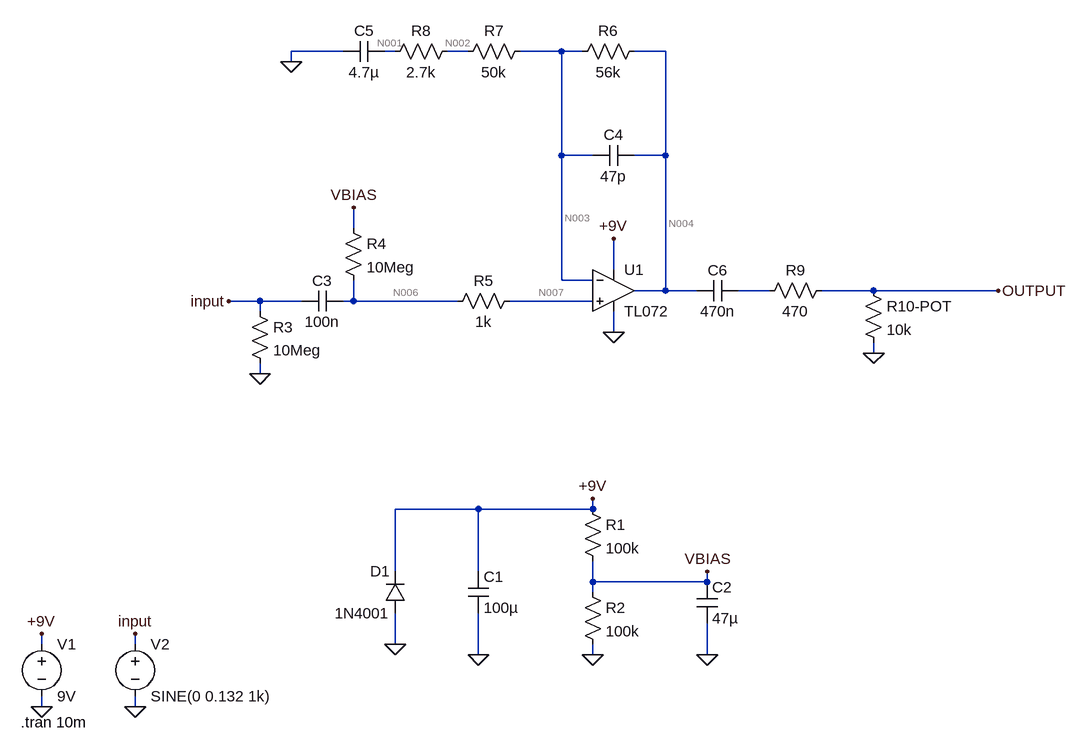
[diagram p0: schematic Boost Pedal.asc]
* Boost Pedal.asc
V1 +9V 0 9V
V2 input 0 SINE(0 0.132 1k)
D1 0 +9V 1N4001
C1 +9V 0 100µ V=25 Irms=250m Rser=0.6 Lser=0 mfg="Nichicon" pn="UPG1E101MPH" type="Al electrolytic"
R1 +9V VBIAS 100k
R2 VBIAS 0 100k
C2 VBIAS 0 47µ V=25 Irms=170m Rser=1 Lser=0 mfg="Nichicon" pn="UPG1E470MPH" type="Al electrolytic"
R3 input 0 10Meg
C3 N006 input 100n
R4 VBIAS N006 10Meg
R5 N007 N006 1k
* U1: TL072 (symbol TL072 not available, pins judged from their places): In+=N007 In-=N003 V+=+9V V-=0 OUT=N004
C4 N004 N003 47p
R6 N004 N003 56k
R7 N003 N002 50k
R8 N002 N001 2.7k
C5 N001 0 4.7µ V=25 Irms=24m Rser=5 Lser=0 mfg="Nichicon" pn="UPR1E4R7MAH" type="Al electrolytic"
C6 N005 N004 470n
R9 OUTPUT N005 470
R10-POT OUTPUT 0 10k
.model D D
.lib standard.dio
.tran 10m
.backanno
.end

* Results of the author's LTspice run, read from the files saved beside the schematic
* Operating Point, zero values left out:
*   V(+9v) = 9 V
*   V(n001) = 4.5 V
*   V(n002) = 4.5 V
*   V(n003) = 4.5 V
*   V(n004) = 4.5 V
*   V(n006) = 4.5 V
*   V(n007) = 4.5 V
*   V(vbias) = 4.5 V
*   I(D1) = -14.12 nA
*   I(R1) = 45 µA
*   I(R2) = 45 µA
*   I(R4) = 34.55 pA
*   I(R5) = -34.55 pA
*   I(R6) = 34.55 pA
*   I(V1) = -4.44 mA
*   Ix(u1:1) = 34.55 pA
*   Ix(u1:2) = 34.55 pA
*   Ix(u1:3) = 4.395 mA
*   Ix(u1:4) = -4.395 mA
*   Ix(u1:5) = -34.55 pA
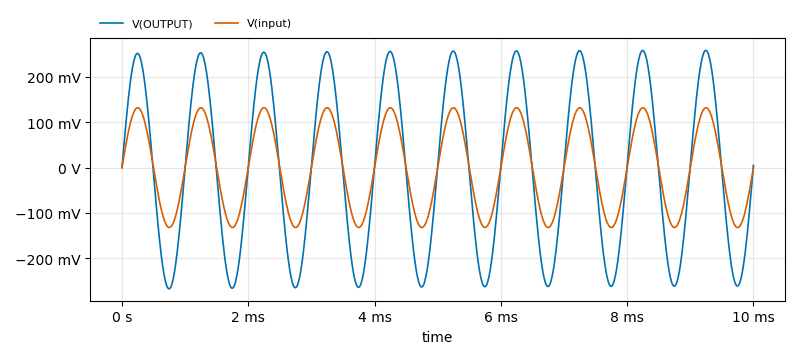
[diagram p1: Transient Analysis of Boost Pedal.asc, plotted from the saved traces]
* Transient Analysis, 1 run:
*   V(OUTPUT): min -267.1 mV, max 258.5 mV, average -3.645 mV, rms 183.6 mV, last 5.038 mV
*   V(input): min -132 mV, max 132 mV, average 0 V, rms 93.34 mV, last 0 V